# Altium schematic sheet A_output.SchDoc
size A; SheetNumber: 8; SheetTotal: 9
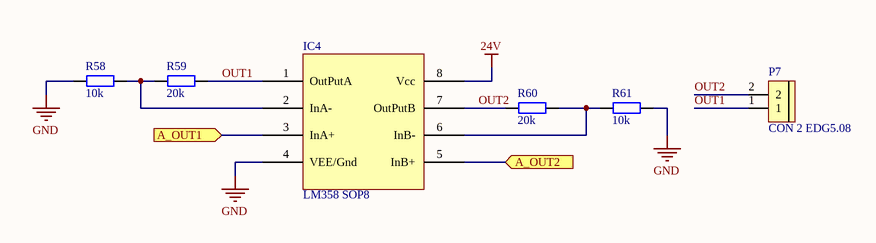
[diagram p0: A_output.SchDoc]

## Parts
IC4  LM358 SOP8  [SOP 8]
P7  CON 2 EDG5.08  [CON 2 2EDG5.08]
R58  10k  [tro smd 0805]
R59  20k  [tro smd 0805]
R60  20k  [tro smd 0805]
R61  10k  [tro smd 0805]

## Ports
A_OUT1 (in), A_OUT2 (in)

## Nets
24V: IC4.8(Vcc)
GND: IC4.4(VEE/Gnd) R58.2 R61.1
A_OUT1: IC4.3(InA+) ; port A_OUT1
A_OUT2: IC4.5(InB+) ; port A_OUT2
OUT1: IC4.1(OutPutA) P7.1 R59.2
OUT2: IC4.7(OutPutB) P7.2 R60.1
NetIC4_2: IC4.2(InA-) R58.1 R59.1
NetIC4_6: IC4.6(InB-) R60.2 R61.2

## Library data of the parts
IC4 = LM358 SOP8: Dán; Ma_Hang: MH000609; Don_Vi: Con; Ten_Linh_Kien: LM358 SOP8; Kieu_Chan: *; Ghi_Chu: *; Chung_Loai: Dán
P7 = CON 2 EDG5.08: Cắm; Ten_Linh_Kien: CON 2 2EDG5.08-2P 5.08MM ( Xanh Cong); Ma_Hang: MH000759; Ghi_Chu: *; Don_Vi: Con; Kieu_Chan: *; Chung_Loai: Cắm
R58 R61 = Tro 0805 1% 10k: Dán; Don_Vi: Con; So_Chan: 2; Ten_Linh_Kien: Trở 0805 1% 10k; Ma_Hang: MH005473; Chung_Loai: Dán; Kieu_Chan: *
R59 R60 = Tro 0805 5% 20k: Dán; Don_Vi: Con; So_Chan: 2; Ten_Linh_Kien: Trở 0805 5% 20k; Ma_Hang: MH005247; Chung_Loai: Dán; Kieu_Chan: *